# Altium schematic sheet Power_Sheet.SchDoc
size A4; SheetNumber: 1; SheetTotal: 1
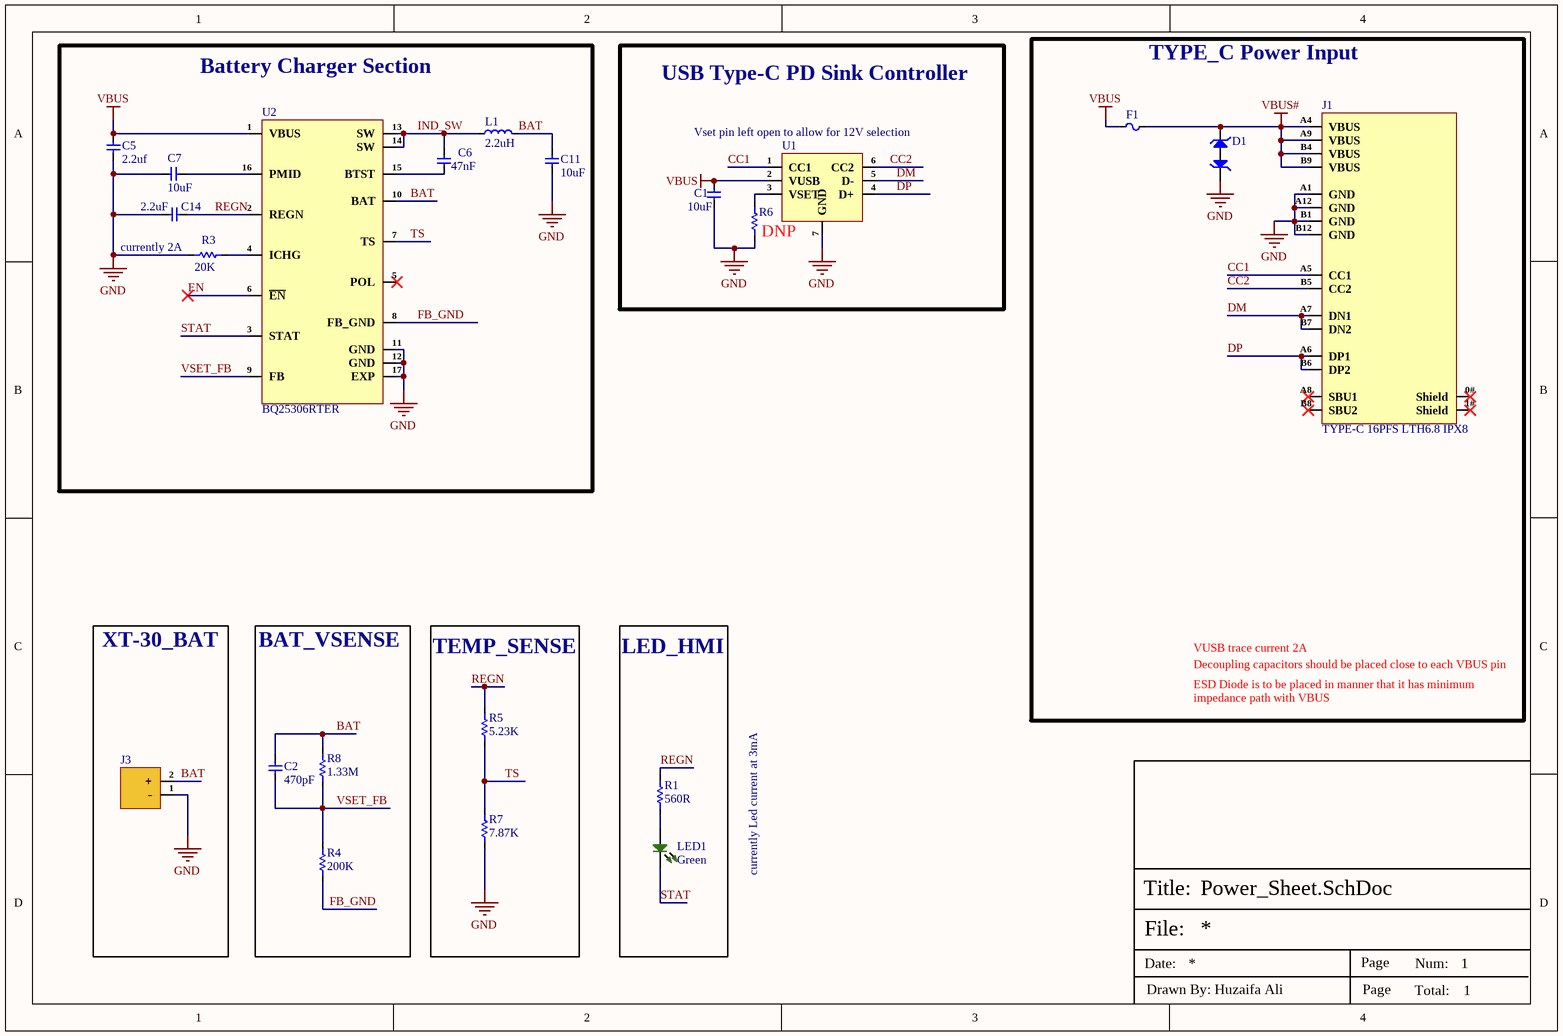
[diagram p0: Power_Sheet.SchDoc]

## Parts
C1  10uF  [Cap-0603]
C2  470pF  [Cap-0402]
C5  2.2uf  [Cap-0402]
C6  47nF  [Cap-0402]
C7  10uF  [Cap-0805]
C11  10uF  [Cap-0805]
C14  2.2uF  [Cap-0402]
D1  PESD12VV1BL,315  [DFN1006-2L (Bi-Directional)]  (value not drawn)
F1  CF06V2T3R15  [Fuse-0603]  (value not drawn)
J1  TYPE-C 16PFS LTH6.8 IPX8  [TYPE-C 16PFS LTH6.8 IPX8]
J3  XT30UPB-M  [XT30UPB-M]  (value not drawn)
L1  2.2uH  [XRTC404030S2R2MGCA]
LED1  Green  [LED-0402]
R1  560R  [Res-0402]
R3  20K  [Res-0402]
R4  200K  [Res-0402]
R5  5.23K  [Res-0402]
R6  DNP  [Res-0201]
R7  7.87K  [Res-0402]
R8  1.33M  [Res-0402]
U1  HUSB237-AA001-DN06R  [DFN-6L-EP(2x2)]  (value not drawn)
U2  BQ25306RTER  [16-WQFN (3x3)]

## Blocks framed on the sheet
Battery Charger Section: C5-C7 C11 C14 L1 R3 U2
USB Type-C PD Sink Controller: C1 R6 U1
TYPE_C Power Input: D1 F1 J1
XT-30_BAT: J3
BAT_VSENSE: C2 R4 R8
TEMP_SENSE: R5 R7
LED_HMI: LED1 R1

## Nets
GND: C1.1 C5.1 C7.1 C11.1 C14.2 D1.1 J1.A1(GND) J1.A12(GND) J1.B1(GND) J1.B12(GND) J3.1(-) R3.1 R6.1 R7.1 U1.7(GND) U2.11(GND) U2.12(GND) U2.17(EXP)
VBUS: C1.2 C5.2 F1.1 U1.2(VUSB) U2.1(VBUS)
VBUS#: D1.2 F1.2 J1.A4(VBUS) J1.A9(VBUS) J1.B4(VBUS) J1.B9(VBUS)
BAT: C2.2 C11.2 J3.2(+) L1.2 R8.2 U2.10(BAT)
CC1: J1.A5(CC1) U1.1(CC1)
CC2: J1.B5(CC2) U1.6(CC2)
DM: J1.A7(DN1) J1.B7(DN2) U1.5(D-)
DP: J1.A6(DP1) J1.B6(DP2) U1.4(D+)
EN: U2.6(~{EN})
FB_GND: R4.1 U2.8(FB_GND)
IND_SW: C6.2 L1.1 U2.13(SW) U2.14(SW)
REGN: C14.1 R1.2 R5.2 U2.2(REGN)
STAT: LED1.2 U2.3(STAT)
TS: R5.1 R7.2 U2.7(TS)
VSET_FB: C2.1 R4.2 R8.1 U2.9(FB)
NetC6_1: C6.1 U2.15(BTST)
NetC7_2: C7.2 U2.16(PMID)
NetLED1_1: LED1.1 R1.1
NetR3_2: R3.2 U2.4(ICHG)
NetR6_2: R6.2 U1.3(VSET)

Not connected (* = marked no-connect by the designer): J1 0#(Shield)* 1#(Shield)* A8(SBU1)* B8(SBU2)*; U2 5(POL)*

## Notes on the sheet
- (near U1) Vset pin left open to allow for 12V selection
- (near R3) currently 2A
- VUSB trace current 2A
- Decoupling capacitors should be placed close to each VBUS pin
- ESD Diode is to be placed in manner that it has minimum impedance path with VBUS
- currently Led current at 3mA
- File:
- Title:
- Date:
- Page
- Num:
- Total:
- Drawn By: Huzaifa Ali

## Library data of the parts
C1 = GRM188R61E106KA73D: CAP CER 10UF 25V X5R 0603; Manufacturer: Murata; Supplier 1: Mouser; Manufacturer Part Number: GRM188R61E106KA73D; RoHS: Yes; Category: Ceramic Capacitors; Stock 1: 319428; Pricing 1: 1=0.36000, 10=0.25800, 50=0.25800, 100=0.15500, 1000=0.09800, 10000=0.06900 (USD); Case/Package: 0603; RoHS Compliant: Yes; ComponentLink1URL: https://search.murata.co.jp/Ceramy/image/img/A01X/G101/ENG/GRM188R61E106KA73-01.pdf?src-supplier=Digi-Key; ComponentLink1Description: https://search.murata.co.jp/Ceramy/image/img/A01X/G101/ENG/GRM188R61E106KA73-01.pdf?src-supplier=Digi-Key; Supplier Part Number 1: 81-GRM188R61E106KA3D; LCSC Part Number: C344022
C2 = GCM155R71H471KA37D: CAP CER 470PF 50V X7R 0402; Manufacturer: Murata; Item Type: Capacitors; Material: 4241ConductorMaterial; Tolerance: 10%; Supplier: Rs; LCSC Part Number: C85859; Manufacturer Part Number: GCM155R71H471KA37D; RoHS: Yes; Stock: 7200; Pricing: 100=0.197, 500=0.175, 5000=0.11 (SEK); Mounting Technology: Surface Mount; Case/Package: 0402; Case Code (Metric): 1005; Case Code (Imperial): 0402; Min Operating Temperature: -55°C; Max Operating Temperature: 125°C; Value: 470pF; Packaging: Tape and Reel; Package Quantity: 1; Voltage Rating: 50V; Dielectric: X7R; Termination: SMD/SMT; Voltage Rating (DC): 50V; Series: GCM; Construction: Flat; Length: 0.039inch; Width: 0.02inch; Height: 0.5mm; Thickness: 0.022inch; Depth: 0.5mm; Ratings: AEC-Q200; Radiation Hardening: No; RoHS Compliant: Yes; ComponentLink1URL: https://datasheet.ciiva.com/131/product-131838.pdf?src-supplier=Digikey; ComponentLink1Description: https://datasheet.ciiva.com/131/product-131838.pdf?src-supplier=Digikey; ComponentLink2URL: https://datasheet.ciiva.com/131/product-131837.pdf?src-supplier=Digikey; ComponentLink2Description: https://datasheet.ciiva.com/131/product-131837.pdf?src-supplier=Digikey; ComponentLink3URL: https://datasheet.ciiva.com/131/product-131839.pdf?src-supplier=Digikey; ComponentLink3Description: https://datasheet.ciiva.com/131/product-131839.pdf?src-supplier=Digikey; ComponentLink4URL: https://datasheet.ciiva.com/11604/product-11604535.pdf?src-supplier=Avnet; ComponentLink4Description: https://datasheet.ciiva.com/11604/product-11604535.pdf?src-supplier=Avnet
C5 = GRM155R61E225KE11D: CAP CER 2.2UF 25V X5R 0402; Manufacturer: Murata; Material: Ceramic; Tolerance: 10%; Item Type: Capacitor; Supplier 1: Avnet; Manufacturer Part Number: GRM155R61E225KE11D; RoHS: Yes; Category: Ceramic Capacitors; Stock 1: 210000; Pricing 1: 10000=0.03830, 20000=0.03623, 40000=0.03416, 60000=0.03209, 80000=0.03002, 100000=0.02795, 1000000=0.02588 (USD); Mount: Surface Mount; Case/Package: 0402; Case Code (Metric): 1005; Case Code (Imperial): 0402; Weight: 0.000212oz; Min Operating Temperature: -55°C; Max Operating Temperature: 85°C; Dielectric: X5R; Capacitance: 2.2uF; Packaging: Tape and Reel; Voltage Rating: 25V; Termination: SMD/SMT; Resistor Type: Ceramic; Voltage Rating (DC): 25V; Package Quantity: 10000; Length: 1mm; Width: 0.5mm; Height: 0.5mm; Thickness: 0.022inch; Lead Free: Lead Free; RoHS Compliant: Yes; ComponentLink1URL: http://www.mouser.com/ds/2/281/c02e-2905.pdf?src-supplier=Mouser; ComponentLink1Description: http://www.mouser.com/ds/2/281/c02e-2905.pdf?src-supplier=Mouser; ComponentLink2URL: http://search.murata.co.jp/Ceramy/image/img/A01X/G101/ENG/GRM155R61E225KE11-01.pdf?src-supplier=Digi-Key; ComponentLink2Description: http://search.murata.co.jp/Ceramy/image/img/A01X/G101/ENG/GRM155R61E225KE11-01.pdf?src-supplier=Digi-Key; ComponentLink3URL: http://search.murata.co.jp/Ceramy/image/img/A01X/partnumbering_e_01.pdf?src-supplier=Digi-Key; ComponentLink3Description: http://search.murata.co.jp/Ceramy/image/img/A01X/partnumbering_e_01.pdf?src-supplier=Digi-Key; ComponentLink4URL: http://psearch.en.murata.com/capacitor/product/GRM155R61E225KE11%23.pdf?src-supplier=Avnet; ComponentLink4Description: http://psearch.en.murata.com/capacitor/product/GRM155R61E225KE11%23.pdf?src-supplier=Avnet; Supplier Part Number 1: GRM155R61E225KE11D; LCSC Part Number: C385032
C6 = GRM155R71E473KA88D: CAP CER 0.047UF 25V X7R 0402; Manufacturer: Murata; Material: Ceramic; Tolerance: 10%; Item Type: Capacitor; Supplier 1: Rs; Manufacturer Part Number: GRM155R71E473KA88D; RoHS: Yes; Category: Ceramic Capacitors; Stock 1: 10000; Pricing 1: 1000=0.00007, 8000=0.00900 (GBP); Mounting Technology: Surface Mount; Case/Package: 0402; Pins: 2; Case Code (Metric): 1005; Case Code (Imperial): 0402; Min Operating Temperature: -55°C; Max Operating Temperature: 125°C; Value: 47nF; Dielectric: X7R; Package Quantity: 1; Voltage Rating: 25V; Packaging: Tape and Reel; Termination: SMD/SMT; Voltage: 25V; Voltage Rating (DC): 25V; Series: GRM; Construction: Flat; Length: 1mm; Width: 0.02inch; Height: 0.5mm; Thickness: 0.022inch; Depth: 0.5mm; Radiation Hardening: No; Reach SVHC Compliant: Yes; Lead Free: Lead Free; RoHS Compliant: Yes; ComponentLink1URL: https://datasheet.ciiva.com/34302/1856425-34302854.pdf?src-supplier=Jameco; ComponentLink1Description: https://datasheet.ciiva.com/34302/1856425-34302854.pdf?src-supplier=Jameco; ComponentLink2URL: https://datasheet.ciiva.com/131/grm155r71e473ka88-01-131494.pdf?src-supplier=Digi-Key; ComponentLink2Description: https://datasheet.ciiva.com/131/grm155r71e473ka88-01-131494.pdf?src-supplier=Digi-Key; ComponentLink3URL: https://datasheet.ciiva.com/18184/getdatasheetpartid-153136-18184712.pdf?src-supplier=Verical; ComponentLink3Description: https://datasheet.ciiva.com/18184/getdatasheetpartid-153136-18184712.pdf?src-supplier=Verical; ComponentLink4URL: https://datasheet.ciiva.com/29199/454180-da-01-en-vs-kondensator-0402-29199826.pdf?src-supplier=Conrad; ComponentLink4Description: https://datasheet.ciiva.com/29199/454180-da-01-en-vs-kondensator-0402-29199826.pdf?src-supplier=Conrad; ComponentLink5URL: https://datasheet.ciiva.com/14103/grmseries-highdielectrictype-eng-14103754.pdf?src-supplier=Distrelec; ComponentLink5Description: https://datasheet.ciiva.com/14103/grmseries-highdielectrictype-eng-14103754.pdf?src-supplier=Distrelec; ComponentLink6URL: https://datasheet.ciiva.com/7937/608985-7937623.pdf?src-supplier=Element14; ComponentLink6Description: https://datasheet.ciiva.com/7937/608985-7937623.pdf?src-supplier=Element14; ComponentLink7URL: https://datasheet.ciiva.com/131/grm155r71e473ka88-01-131493.pdf?src-supplier=Digi-Key; ComponentLink7Description: https://datasheet.ciiva.com/131/grm155r71e473ka88-01-131493.pdf?src-supplier=Digi-Key; ComponentLink8URL: https://datasheet.ciiva.com/131/grm155r71e473ka88-01-131492.pdf?src-supplier=Digi-Key; ComponentLink8Description: https://datasheet.ciiva.com/131/grm155r71e473ka88-01-131492.pdf?src-supplier=Digi-Key; ComponentLink9URL: https://datasheet.ciiva.com/5424/product-5424844.pdf?src-supplier=Mouser; ComponentLink9Description: https://datasheet.ciiva.com/5424/product-5424844.pdf?src-supplier=Mouser; ComponentLink10URL: https://datasheet.ciiva.com/2989/product-2989395.pdf?src-supplier=Avnet; ComponentLink10Description: https://datasheet.ciiva.com/2989/product-2989395.pdf?src-supplier=Avnet; ComponentLink11URL: https://datasheet.ciiva.com/16213/product-16213823.pdf?src-supplier=Future+Electronics; ComponentLink11Description: https://datasheet.ciiva.com/16213/product-16213823.pdf?src-supplier=Future+Electronics; Supplier Part Number 1: 2478015P; LCSC Part Number: C77017
C7 = CC0805KKX5R8BB106: CAP CER 10UF 25V X5R 0805; Manufacturer: Yageo; Tolerance: 10%; Item Type: Capacitor; Supplier 1: Digi-Key; Manufacturer Part Number: CC0805KKX5R8BB106; RoHS: Yes; Category: Ceramic Capacitors; Stock 1: 554290; Pricing 1: 1=0.31000, 10=0.21200, 50=0.14820, 100=0.12710, 500=0.09534, 1000=0.08050 (USD); Mount: Surface Mount; Case/Package: 0805; Case Code (Imperial): 0805; Case Code (Metric): 2012; Weight: 0.000194oz; Min Operating Temperature: -55°C; Max Operating Temperature: 85°C; Capacitance: 10uF; Voltage Rating (DC): 25V; Packaging: Tape and Reel; Voltage Rating: 25V; Dielectric: X5R; Termination: SMD/SMT; Resistor Type: Ceramic; Series: CC; Length: 0.079inch; Width: 0.049inch; Thickness: 0.057inch; Depth: 1.25mm; Lead Free: Lead Free; Halogen Free: Halogen Free; RoHS Compliant: Yes; ComponentLink1URL: http://www.mouser.com/ds/2/447/UPY-GPHC_X5R_4V-to-50V_25-1131599.pdf?src-supplier=Mouser; ComponentLink1Description: http://www.mouser.com/ds/2/447/UPY-GPHC_X5R_4V-to-50V_25-1131599.pdf?src-supplier=Mouser; ComponentLink2URL: http://www.yageo.com/documents/recent/UPY-GPHC_X5R_4V-to-50V_25.pdf?src-supplier=Digi-Key; ComponentLink2Description: http://www.yageo.com/documents/recent/UPY-GPHC_X5R_4V-to-50V_25.pdf?src-supplier=Digi-Key; Supplier Part Number 1: 311-1869-1-ND; LCSC Part Number: C89831
C11 = EMK212BB7106MG-T: CAP CER 10UF 16V X7R 0805; Manufacturer: Taiyo Yuden; Tolerance: 20%; Item Type: Capacitor; Supplier 1: Digi-Key; Manufacturer Part Number: EMK212BB7106MG-T; RoHS: Yes; Category: Ceramic Capacitors; Stock 1: 896107; Pricing 1: 1=0.40000, 10=0.28000, 50=0.19620, 100=0.16820, 500=0.12612, 1000=0.10650 (USD); Mount: Surface Mount; Case/Package: 0805; Case Code (Metric): 2012; Case Code (Imperial): 0805; Min Operating Temperature: -55°C; Max Operating Temperature: 125°C; Package Quantity: 3000; Packaging: Tape and Reel; Capacitance: 10uF; Voltage Rating: 16V; Voltage Rating (DC): 16V; Dielectric: X7R; Termination: SMD/SMT; Resistor Type: Ceramic; Length: 2mm; Width: 0.049inch; Height: 1.25mm; Thickness: 0.053inch; Ratings: AEC-Q200; Halogen Free: Halogen Free; RoHS Compliant: Yes; ComponentLink1URL: https://datasheet.ciiva.com/24393/472emk212bb7106mg-t-24393497.pdf?src-supplier=Onlinecomponents.com; ComponentLink1Description: https://datasheet.ciiva.com/24393/472emk212bb7106mg-t-24393497.pdf?src-supplier=Onlinecomponents.com; ComponentLink2URL: https://datasheet.ciiva.com/30229/379emk212bb7106mg-t-30229719.pdf?src-supplier=Onlinecomponents.com; ComponentLink2Description: https://datasheet.ciiva.com/30229/379emk212bb7106mg-t-30229719.pdf?src-supplier=Onlinecomponents.com; ComponentLink3URL: https://datasheet.ciiva.com/18697/mlcc-all-e-18697736.pdf?src-supplier=Digi-Key; ComponentLink3Description: https://datasheet.ciiva.com/18697/mlcc-all-e-18697736.pdf?src-supplier=Digi-Key; ComponentLink4URL: https://datasheet.ciiva.com/18697/mlcc-all-e-18697735.pdf?src-supplier=Digi-Key; ComponentLink4Description: https://datasheet.ciiva.com/18697/mlcc-all-e-18697735.pdf?src-supplier=Digi-Key; ComponentLink5URL: https://datasheet.ciiva.com/18697/mlcc-all-e-18697737.pdf?src-supplier=Digi-Key; ComponentLink5Description: https://datasheet.ciiva.com/18697/mlcc-all-e-18697737.pdf?src-supplier=Digi-Key; ComponentLink6URL: https://datasheet.ciiva.com/15376/mlcc01-e-15376088.pdf?src-supplier=Mouser; ComponentLink6Description: https://datasheet.ciiva.com/15376/mlcc01-e-15376088.pdf?src-supplier=Mouser; Supplier Part Number 1: 587-3319-1-ND; LCSC Part Number: C141287
C14 = GRM155R61C225KE11D: CAP CER 2.2UF 16V X5R 0402; Manufacturer: Murata; Item Type: Capacitors; Material: Ceramic; Tolerance: 10%; Supplier: Future Electronics; LCSC Part Number: C88944; Manufacturer Part Number: GRM155R61C225KE11D; RoHS: Yes; Stock: 80000; Pricing: 10000=0.0294, 20000=0.0289, 30000=0.0287, 40000=0.0285, 50000=0.0279 (USD); Mounting Technology: Surface Mount; Case/Package: 0402; Case Code (Metric): 1005; Case Code (Imperial): 0402; Min Operating Temperature: -55°C; Max Operating Temperature: 85°C; Value: 2.2uF; Packaging: Cut Tape; Voltage Rating: 16V; Voltage Rating (DC): 16V; Series: GRM; Length: 0.039inch; Width: 0.02inch; Height: 0.3mm; Thickness: 0.022inch; Lead Free: Lead Free; RoHS Compliant: Yes; ComponentLink1URL: http://www.mouser.com/ds/2/281/c02e-2905.pdf?src-supplier=Mouser; ComponentLink1Description: http://www.mouser.com/ds/2/281/c02e-2905.pdf?src-supplier=Mouser; ComponentLink2URL: https://datasheet.octopart.com/GRM155R61C225KE11D-Murata-datasheet-149522998.pdf?src-supplier=Newark; ComponentLink2Description: https://datasheet.octopart.com/GRM155R61C225KE11D-Murata-datasheet-149522998.pdf?src-supplier=Newark; ComponentLink3URL: https://datasheet.octopart.com/GRM155R61C225KE11D-Murata-datasheet-66001083.pdf?src-supplier=Future+Electronics; ComponentLink3Description: https://datasheet.octopart.com/GRM155R61C225KE11D-Murata-datasheet-66001083.pdf?src-supplier=Future+Electronics; ComponentLink4URL: https://search.murata.co.jp/Ceramy/image/img/A01X/G101/ENG/GRM155R61C225KE11-01.pdf?src-supplier=Digikey; ComponentLink4Description: https://search.murata.co.jp/Ceramy/image/img/A01X/G101/ENG/GRM155R61C225KE11-01.pdf?src-supplier=Digikey; ComponentLink5URL: https://datasheet.octopart.com/GRM155R61C225KE11D-Murata-datasheet-165579666.pdf?src-supplier=TME; ComponentLink5Description: https://datasheet.octopart.com/GRM155R61C225KE11D-Murata-datasheet-165579666.pdf?src-supplier=TME
D1 = PESD12VV1BL,315: TVS DIODE 12VWM 38VC DFN1006-2; Manufacturer: Nexperia; Polarity: 211Direction; Value: 25pF; Number of Channels: 1NUMBER; Min Breakdown Voltage: 14.6V; Peak Pulse Current: 7.8A; Peak Pulse Power: 290W; Power Line Protection: 5898YesNo; Reverse Standoff Voltage: 12V; Clamping Voltage: 38V; Element Configuration: 5460ElementConfiguration; Leakage Current: 10nA; Supplier: Future Electronics; LCSC Part Number: C111472; Manufacturer Part Number: PESD12VV1BL,315; RoHS: Yes; Item Type: Diode; Stock: 70000; Pricing: 10000=0.029, 30000=0.028, 40000=0.0277, 100000=0.0269, 150000=0.0261 (USD); Mounting Technology: 8Mount; Case/Package: 111Case; Pins: 2NUMBER; Min Operating Temperature: -55°C; Max Operating Temperature: 150°C; Termination: 4890ConnectorType; Number of Bidirectional Channels: 1NUMBER; Working Voltage: 12V; Direction: 211Direction; Breakdown Voltage: 14.6V; Max Power Dissipation: 290W; Length: 1.02mm; Depth: 620um; Radiation Hardening: 5898YesNo; ComponentLink1URL: http://www.farnell.com/datasheets/2178732.pdf?src-supplier=Farnell; ComponentLink1Description: http://www.farnell.com/datasheets/2178732.pdf?src-supplier=Farnell; ComponentLink2URL: https://assets.nexperia.com/documents/data-sheet/PESD12VV1BL.pdf?src-supplier=Digikey; ComponentLink2Description: https://assets.nexperia.com/documents/data-sheet/PESD12VV1BL.pdf?src-supplier=Digikey
F1 = CF06V2T3R15: 50A SMD Fuse 3.15A 24V 0603 Disposable fuses ROHS; Manufacturer: TA-I Tech; Manufacturer Part Number: CF06V2T3R15; Package: 0603; LCSC Part Number: C163108; Item Type: Fuses; ComponentLink1Description: LCSC; ComponentLink1URL: https://www.lcsc.com/product-detail/Disposable-fuses_TA-I-Tech-CF06V2T3R15_C163108.html
J1 = TYPE-C 16PFS LTH6.8 IPX8: USB 3.1 3A 1 Standing paste 16P Mother -35℃~+85℃ Type-C SMD USB Connectors ROHS; Manufacturer: SHOU HAN; Manufacturer Part Number: TYPE-C 16PFS LTH6.8 IPX8; Package: SMD; LCSC Part Number: C3020049; Item Type: USB Connector; ComponentLink1Description: LCSC; ComponentLink1URL: https://www.lcsc.com/product-detail/USB-Connectors_SHOU-HAN-TYPE-C-16PFS-LTH6-8-IPX8_C3020049.html
J3 = XT30UPB-M: Plug; Manufacturer: Changzhou Amass Elec; Manufacturer Part Number: XT30UPB-M; Package: -; LCSC Part Number: C428721; Item Type: Plug; ComponentLink1Description: LCSC; ComponentLink1URL: https://www.lcsc.com/product-detail/plug_Changzhou-Amass-Elec-XT30UPB-M_C428721.html
L1 = XRTC404030S2R2MGCA: 9A 2.2uH ±20% 10.5A SMD,4x4mm Power Inductors ROHS  IR 19/22mOhm; Manufacturer: XR; Manufacturer Part Number: XRTC404030S2R2MGCA; Package: SMD,4x4mm; LCSC Part Number: C39846868; Item Type: Inductors; ComponentLink1Description: LCSC; ComponentLink1URL: https://www.lcsc.com/product-detail/Power-Inductors_XR-XRTC404030S2R2MGCA_C39846868.html
LED1 = 16-213/GHC-YR1S1/3T: Green 520~535nm 0402 Light Emitting Diodes (LED) RoHS; Manufacturer: Everlight Elec; Luminous Intensity (IF=20mA): 112~285mcd; Package: 0402; Illumination Color: Green; Dominant Wavelength / Coordinate rank: 520~535nm; Mounting Type: Surface Mount; Manufacturer Part Number: 16-213/GHC-YR1S1/3T; ComponentLink1Description: LCSC; ComponentLink1URL: https://www.lcsc.com/product-detail/Light-Emitting-Diodes-LED_Everlight-Elec-16-213-GHC-YR1S1-3T_C74338.html; LCSC Part Number: C74338; Item Type: LED
R1 = RC0402FR-07560RL: RES 560 OHM 1% 1/16W 0402; Manufacturer: Yageo; Power Rating: 63mW; Temperature Coefficient: 100ppm/°C; Voltage Rating: 50V; Item Type: Resistor; Supplier: Future Electronics; Supplier Part Number: 8872046; Manufacturer Part Number: RC0402FR-07560RL; RoHS: Yes; Category: Chip SMD Resistors; Stock: 1360000; Pricing: 10000=0.0012, 100000=0.0011, 300000=0.0011, 1250000=0.001, 3000000=0.0009 (USD); Case/Package: 0402; Case Code (Metric): 1005; Case Code (Imperial): 0402; Min Operating Temperature: -55°C; Max Operating Temperature: 155°C; Tolerance: 1%; Packaging: Tape and Reel; Value: 560R; Package Quantity: 1; Resistor Type: Thick Film; Number of Terminations: 2; Termination: SMD/SMT; Max Power Dissipation: 63mW; Features: Moisture Resistant; Series: RC; Construction: Rectangular; Resistance Tolerance: 1%; Length: 1mm; Width: 0.02inch; Height: 0.016inch; Depth: 0.5mm; RoHS Compliant: Yes; Military Standard: Not; Lead Free: Lead Free; Reach SVHC Compliant: Unknown; ComponentLink1URL: https://datasheet.ciiva.com/2453/pyu-r-int-thick-7-2453458.pdf?src-supplier=Digikey; ComponentLink1Description: https://datasheet.ciiva.com/2453/pyu-r-int-thick-7-2453458.pdf?src-supplier=Digikey; ComponentLink2URL: https://datasheet.ciiva.com/2453/pyu-r-int-thick-7-2453459.pdf?src-supplier=Digikey; ComponentLink2Description: https://datasheet.ciiva.com/2453/pyu-r-int-thick-7-2453459.pdf?src-supplier=Digikey; ComponentLink3URL: https://datasheet.ciiva.com/2453/pyu-r-int-thick-7-2453457.pdf?src-supplier=Digikey; ComponentLink3Description: https://datasheet.ciiva.com/2453/pyu-r-int-thick-7-2453457.pdf?src-supplier=Digikey; ComponentLink4URL: https://datasheet.ciiva.com/12558/pyu-rc0402-51-rohs-l-6-r-8721-12558383.pdf?src-supplier=Mouser; ComponentLink4Description: https://datasheet.ciiva.com/12558/pyu-rc0402-51-rohs-l-6-r-8721-12558383.pdf?src-supplier=Mouser; ComponentLink5URL: https://datasheet.ciiva.com/7850/1018594-7850042.pdf?src-supplier=Element14; ComponentLink5Description: https://datasheet.ciiva.com/7850/1018594-7850042.pdf?src-supplier=Element14; ComponentLink6URL: https://datasheet.ciiva.com/7850/1018594-7850043.pdf?src-supplier=Element14; ComponentLink6Description: https://datasheet.ciiva.com/7850/1018594-7850043.pdf?src-supplier=Element14; LCSC Part Number: C163460
R3 = RC0402FR-0720KL: RES 20K OHM 1% 1/16W 0402; Manufacturer: Yageo; Resistance: 20kR; Power Rating: 62.5mW; Voltage Rating: 50V; Temperature Coefficient: 100ppm/°C; Max Power Dissipation: 63mW; Item Type: Resistor; Supplier 1: Avnet; Manufacturer Part Number: RC0402FR-0720KL; RoHS: Yes; Category: Chip SMD Resistors; Stock 1: 1960708; Pricing 1: 10000=0.00085 (USD); Case/Package: 0402; Number of Pins: 2; Case Code (Metric): 1005; Case Code (Imperial): 0402; Size Code: 0402; Min Operating Temperature: -55°C; Max Operating Temperature: 155°C; Tolerance: 1%; Package Quantity: 1; Packaging: Tape and Reel; Resistor Type: Thick Film; Number of Terminations: 2; Termination: SMD/SMT; Voltage Rating (DC): 50V; Features: Moisture Resistant; Series: RC; Technology: THICK FILM; Resistance Tolerance: 1%; Construction: Rectangular; Length: 1mm; Width: 0.02inch; Height: 0.016inch; Depth: 0.5mm; RoHS Compliant: Yes; Reach SVHC Compliant: Yes; Military Standard: Not; Lead Free: Lead Free; ComponentLink1URL: https://datasheet.ciiva.com/11808/0900766b80c66297-11808454.pdf?src-supplier=RSComponents; ComponentLink1Description: https://datasheet.ciiva.com/11808/0900766b80c66297-11808454.pdf?src-supplier=RSComponents; ComponentLink2URL: https://datasheet.ciiva.com/7983/1018594-7983511.pdf?src-supplier=Element14; ComponentLink2Description: https://datasheet.ciiva.com/7983/1018594-7983511.pdf?src-supplier=Element14; ComponentLink3URL: https://datasheet.ciiva.com/46394/1018594-46394974.pdf?src-supplier=Element14; ComponentLink3Description: https://datasheet.ciiva.com/46394/1018594-46394974.pdf?src-supplier=Element14; ComponentLink4URL: https://datasheet.ciiva.com/2453/pyu-r-int-thick-7-2453494.pdf?src-supplier=Digi-Key; ComponentLink4Description: https://datasheet.ciiva.com/2453/pyu-r-int-thick-7-2453494.pdf?src-supplier=Digi-Key; ComponentLink5URL: https://datasheet.ciiva.com/2453/pyu-r-int-thick-7-2453495.pdf?src-supplier=Digi-Key; ComponentLink5Description: https://datasheet.ciiva.com/2453/pyu-r-int-thick-7-2453495.pdf?src-supplier=Digi-Key; ComponentLink6URL: https://datasheet.ciiva.com/2453/pyu-r-int-thick-7-2453493.pdf?src-supplier=Digi-Key; ComponentLink6Description: https://datasheet.ciiva.com/2453/pyu-r-int-thick-7-2453493.pdf?src-supplier=Digi-Key; ComponentLink7URL: https://datasheet.ciiva.com/12558/pyu-rc0402-51-rohs-l-6-r-8721-12558796.pdf?src-supplier=Mouser; ComponentLink7Description: https://datasheet.ciiva.com/12558/pyu-rc0402-51-rohs-l-6-r-8721-12558796.pdf?src-supplier=Mouser; Supplier Part Number 1: RC0402FR-0720KL; LCSC Part Number: C93942
R4 = RC0402DR-07200KL: RES 200K OHM 0.5% 1/16W 0402; Manufacturer: Yageo; Resistance: 200kR; Max Power Dissipation: 63mW; Temperature Coefficient: 100ppm/°C; Supplier 1: Mouser; Manufacturer Part Number: RC0402DR-07200KL; RoHS: Yes; Category: Chip SMD Resistors; Pricing 1: 1=0.13000, 10=0.07000, 50=0.07000, 100=0.02900, 1000=0.01300, 10000=0.00700 (USD); Case/Package: 0402; Min Operating Temperature: -55°C; Max Operating Temperature: 155°C; Packaging: Tape and Reel; Resistor Type: Thick Film; Number of Terminations: 2; Tolerance: 0.5%; Features: Moisture Resistant; Length: 0.039inch; Width: 0.02inch; Height: 0.016inch; ComponentLink1URL: http://www.yageo.com.tw/exep/pages/download/literatures/PYu-R_INT-thick_7.pdf?src-supplier=Digi-Key; ComponentLink1Description: http://www.yageo.com.tw/exep/pages/download/literatures/PYu-R_INT-thick_7.pdf?src-supplier=Digi-Key; Supplier Part Number 1: 603-RC0402DR-07200KL; LCSC Part Number: C138077
R5 = CRCW04025K23FKED: RES SMD 5.23K OHM 1% 1/16W 0402; Manufacturer: Vishay; Item Type: Resistors; Value: 5.23kR; Power Rating: 63mW; Temperature Coefficient: 100ppm/°C; Voltage Rating: 50V; Supplier: Avnet; LCSC Part Number: C2076550; Manufacturer Part Number: CRCW04025K23FKED; RoHS: Yes; Stock: 10000; Pricing: 20000=0.00245 (USD); Case/Package: 0402; Pins: 2; Contact Plating: Tin; Weight: 2.3E-05oz; Case Code (Imperial): 0402; Case Code (Metric): 1005; Min Operating Temperature: -55°C; Max Operating Temperature: 155°C; Tolerance: 1%; Packaging: Tape and Reel; Package Quantity: 10; Termination: SMD/SMT; Number of Terminations: 2; Max Power Dissipation: 63mW; Features: Automotive AEC-Q200; Series: CRCW; Resistor Type: Thick Film; Working Voltage: 50V; Resistance Tolerance: 1%; Technology: THICK FILM; Voltage Rating (DC): 50V; Length: 1mm; Width: 0.02inch; Height: 0.35mm; Depth: 0.5mm; Radiation Hardening: No; RoHS Compliant: Yes; Lead Free: 5697LeadFree; Reach SVHC Compliant: Unknown; ComponentLink1URL: https://datasheet.ciiva.com/7679/1697337-7679068.pdf?src-supplier=Element14; ComponentLink1Description: https://datasheet.ciiva.com/7679/1697337-7679068.pdf?src-supplier=Element14; ComponentLink2URL: https://datasheet.ciiva.com/22702/1697337-22702815.pdf?src-supplier=Element14; ComponentLink2Description: https://datasheet.ciiva.com/22702/1697337-22702815.pdf?src-supplier=Element14; ComponentLink3URL: https://datasheet.ciiva.com/2463/dcrcwe3-2463422.pdf?src-supplier=Digikey; ComponentLink3Description: https://datasheet.ciiva.com/2463/dcrcwe3-2463422.pdf?src-supplier=Digikey; ComponentLink4URL: https://datasheet.ciiva.com/6051/125364-6051350.pdf?src-supplier=Farnell; ComponentLink4Description: https://datasheet.ciiva.com/6051/125364-6051350.pdf?src-supplier=Farnell; ComponentLink5URL: https://datasheet.ciiva.com/7743/125364-7743706.pdf?src-supplier=Element14; ComponentLink5Description: https://datasheet.ciiva.com/7743/125364-7743706.pdf?src-supplier=Element14; ComponentLink6URL: https://datasheet.ciiva.com/7679/1697337-7679069.pdf?src-supplier=Element14; ComponentLink6Description: https://datasheet.ciiva.com/7679/1697337-7679069.pdf?src-supplier=Element14; ComponentLink7URL: https://datasheet.ciiva.com/2463/dcrcwe3-2463423.pdf?src-supplier=Digikey; ComponentLink7Description: https://datasheet.ciiva.com/2463/dcrcwe3-2463423.pdf?src-supplier=Digikey; ComponentLink8URL: https://datasheet.ciiva.com/2463/dcrcwe3-2463421.pdf?src-supplier=Digikey; ComponentLink8Description: https://datasheet.ciiva.com/2463/dcrcwe3-2463421.pdf?src-supplier=Digikey; ComponentLink9URL: https://datasheet.ciiva.com/16767/70201119-16767021.pdf?src-supplier=Allied+Electronics; ComponentLink9Description: https://datasheet.ciiva.com/16767/70201119-16767021.pdf?src-supplier=Allied+Electronics; ComponentLink10URL: https://datasheet.ciiva.com/22869/70201119-22869546.pdf?src-supplier=Allied+Electronics; ComponentLink10Description: https://datasheet.ciiva.com/22869/70201119-22869546.pdf?src-supplier=Allied+Electronics; ComponentLink11URL: https://datasheet.ciiva.com/3256/dcrcwe3-3256686.pdf?src-supplier=Avnet; ComponentLink11Description: https://datasheet.ciiva.com/3256/dcrcwe3-3256686.pdf?src-supplier=Avnet; ComponentLink12URL: https://datasheet.ciiva.com/16200/dcrcwe3-16200567.pdf?src-supplier=Future+Electronics; ComponentLink12Description: https://datasheet.ciiva.com/16200/dcrcwe3-16200567.pdf?src-supplier=Future+Electronics
R6 = 0201WMF7502TEE: 50mW Thick Film Resistors 25V ±1% ±200ppm/℃ 75kΩ 0201 Chip Resistor - Surface Mount ROHS; Manufacturer: UNI-ROYAL; Manufacturer Part Number: 0201WMF7502TEE; Package: 0201; LCSC Part Number: C270339; Item Type: Resistor; ComponentLink1Description: LCSC; ComponentLink1URL: https://www.lcsc.com/product-detail/Chip-Resistor-Surface-Mount_UNI-ROYAL-Uniroyal-Elec-0201WMF7502TEE_C270339.html
R7 = RT0402BRD077K87L: RES SMD 7.87KOHM 0.1% 1/16W 0402; Manufacturer: Yageo; Item Type: Resistors; Value: 7.87kR; Power Rating: 62.5mW; Voltage Rating: 50V; Max Power Dissipation: 63mW; Temperature Coefficient: 25ppm/°C; Supplier: Farnell; LCSC Part Number: C852920; Manufacturer Part Number: RT0402BRD077K87L; RoHS: Yes; Stock: 16247; Pricing: 10=1.13, 100=0.981, 500=0.57, 2500=0.512, 5000=0.454, 10000=0.411, 50000=0.403, 100000=0.394 (SEK); Case/Package: 0402; Case Code (Metric): 1005; Case Code (Imperial): 0402; Weight: 2.3E-05oz; Min Operating Temperature: -55°C; Max Operating Temperature: 155°C; Package Quantity: 10000; Packaging: Tape and Reel; Tolerance: 0.1%; Number of Terminations: 2; Termination: SMD/SMT; Voltage Rating (DC): 50V; Features: Moisture Resistant; Series: RT; Length: 0.039inch; Width: 0.5mm; Height: 0.014inch; Lead Free: Lead Free; RoHS Compliant: Yes; ComponentLink1URL: https://datasheet.ciiva.com/2582/pyu-rt-1-to-0-05-rohs-l-4-2582499.pdf?src-supplier=Digikey; ComponentLink1Description: https://datasheet.ciiva.com/2582/pyu-rt-1-to-0-05-rohs-l-4-2582499.pdf?src-supplier=Digikey; ComponentLink2URL: https://datasheet.ciiva.com/12796/pyu-rt-1-to-0-05-rohs-l-4-12796502.pdf?src-supplier=Mouser; ComponentLink2Description: https://datasheet.ciiva.com/12796/pyu-rt-1-to-0-05-rohs-l-4-12796502.pdf?src-supplier=Mouser; ComponentLink3URL: https://datasheet.ciiva.com/46635/pyu-rt-1-to-0-05-rohs-l-5-46635069.pdf?src-supplier=Digikey; ComponentLink3Description: https://datasheet.ciiva.com/46635/pyu-rt-1-to-0-05-rohs-l-5-46635069.pdf?src-supplier=Digikey
R8 = FRC0402F1334TS: 62.5mW Thick Film Resistors 50V ±100ppm/℃ ±1% 1.33MΩ 0402 Chip Resistor - Surface Mount ROHS; Manufacturer: FOJAN; Manufacturer Part Number: FRC0402F1334TS; Package: 0402; Item Type: Resistor; LCSC Part Number: C5713265; ComponentLink1Description: LCSC; ComponentLink1URL: https://www.lcsc.com/product-detail/Chip-Resistor-Surface-Mount_FOJAN-FRC0402F1334TS_C5713265.html
U1 = HUSB237-AA001-DN06R: DFN-6L-EP(2x2) USB PD ROHS; Manufacturer: Hynetek; Item Type: IC; Manufacturer Part Number: HUSB237-AA001-DN06R; Package: DFN-6L-EP(2x2); LCSC Part Number: C22373734; ComponentLink1Description: LCSC; ComponentLink1URL: https://www.lcsc.com/product-detail/USB-PD_Hynetek-HUSB237-AA001-DN06R_C22373734.html
U2 = BQ25306RTER: STANDALONE 17-V, 3-A SINGLE CELL; Manufacturer: Texas Instruments; Item Type: IC; Supplier: Mouser; LCSC Part Number: C3682611; Manufacturer Part Number: BQ25306RTER; RoHS: Yes; Stock: 4465; Pricing: 1=2.27, 10=1.48, 50=1.48, 100=1.21, 1000=1.11, 10000=0.937 (USD)